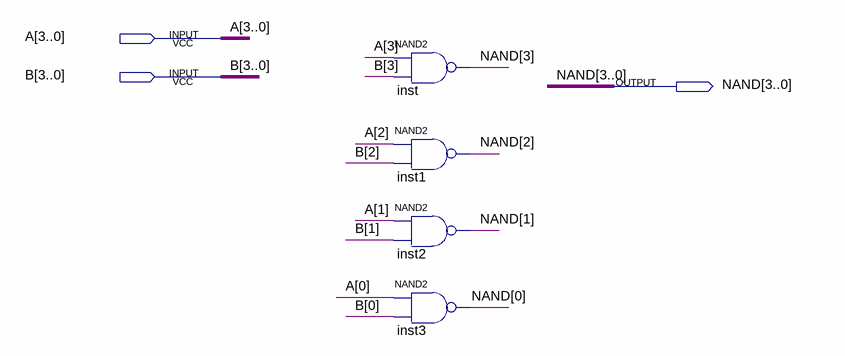
[diagram p0: schematic sheet]
// Quartus schematic NAND_4bit.bdf as structural Verilog: 4 symbols, 3 pins
module NAND_4bit (
  input  [3:0] A,
  input  [3:0] B,
  output [3:0] NAND
);

  nand inst (NAND[3], A[3], B[3]);
  nand inst1 (NAND[2], A[2], B[2]);
  nand inst2 (NAND[1], A[1], B[1]);
  nand inst3 (NAND[0], A[0], B[0]);
endmodule
